# Altium schematic sheet Block_ADCS_Actuation.SchDoc
size A4; SheetNumber: 4; SheetTotal: 5
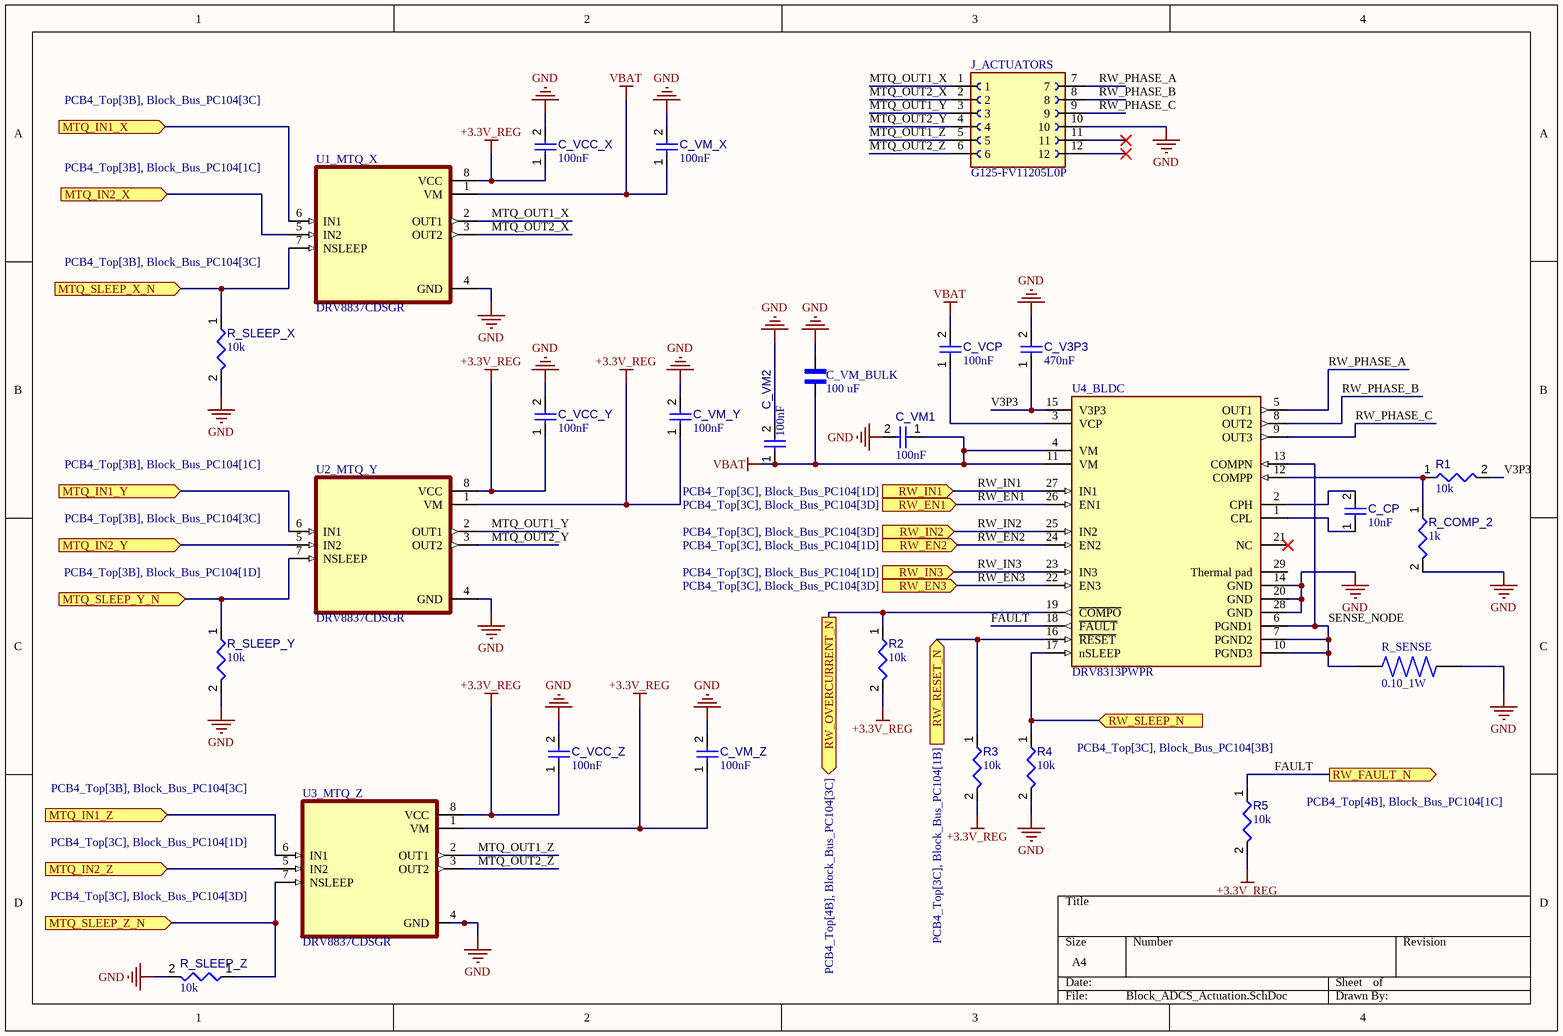
[diagram p0: Block_ADCS_Actuation.SchDoc]

## Parts
C_CP  value 10nF  [CAPC0402(1005)60_L]  (hidden comment: Capacitor 10nF +/-20% 50V 0402)
C_V3P3  value 470nF  [CAPC0603(1608)100_L]  (hidden comment: Capacitor 470nF +/-20% 25V 0603)
C_VCC_X  value 100nF  [CAPC1608X90X40NL10T20]  (hidden comment: Capacitor 100 nF +/-10% 50 V 0603)
C_VCC_Y  value 100nF  [CAPC1608X90X40NL10T20]  (hidden comment: Capacitor 100 nF +/-10% 50 V 0603)
C_VCC_Z  value 100nF  [CAPC1608X90X40NL10T20]  (hidden comment: Capacitor 100 nF +/-10% 50 V 0603)
C_VCP  value 100nF  [CAPC1608X90X40NL10T20]  (hidden comment: Capacitor 100 nF +/-10% 50 V 0603)
C_VM1  value 100nF  [CAPC1608X90X40NL10T20]  (hidden comment: Capacitor 100 nF +/-10% 50 V 0603)
C_VM2  value 100nF  [CAPC1608X90X40NL10T20]  (hidden comment: Capacitor 100 nF +/-10% 50 V 0603)
C_VM_BULK  100 uF  [CAPC3225X280N]
C_VM_X  value 100nF  [CAPC1608X90X40NL10T20]  (hidden comment: Capacitor 100 nF +/-10% 50 V 0603)
C_VM_Y  value 100nF  [CAPC1608X90X40NL10T20]  (hidden comment: Capacitor 100 nF +/-10% 50 V 0603)
C_VM_Z  value 100nF  [CAPC1608X90X40NL10T20]  (hidden comment: Capacitor 100 nF +/-10% 50 V 0603)
J_ACTUATORS  G125-FV11205L0P  [HARWIN_G125-FV11205L0P]
R1  value 10k  [RESC1608X55X25ML10T15]  (hidden comment: Resistor 10k +/-1% 0603 100 mW)
R2  value 10k  [RESC1608X55X25ML10T15]  (hidden comment: Resistor 10k +/-1% 0603 100 mW)
R3  value 10k  [RESC1608X55X25ML10T15]  (hidden comment: Resistor 10k +/-1% 0603 100 mW)
R4  value 10k  [RESC1608X55X25ML10T15]  (hidden comment: Resistor 10k +/-1% 0603 100 mW)
R5  value 10k  [RESC1608X55X25ML10T15]  (hidden comment: Resistor 10k +/-1% 0603 100 mW)
R_COMP_2  value 1k  [RESC1608X55X25ML10T15]  (hidden comment: Resistor 1k +/-1% 0603 100 mW)
R_SENSE  0.10_1W  [RESC3216X89N]
R_SLEEP_X  value 10k  [RESC1608X55X25ML10T15]  (hidden comment: Resistor 10k +/-1% 0603 100 mW)
R_SLEEP_Y  value 10k  [RESC1608X55X25ML10T15]  (hidden comment: Resistor 10k +/-1% 0603 100 mW)
R_SLEEP_Z  value 10k  [RESC1608X55X25ML10T15]  (hidden comment: Resistor 10k +/-1% 0603 100 mW)
U1_MTQ_X  DRV8837CDSGR  [SON50P200X200X80-9N]
U2_MTQ_Y  DRV8837CDSGR  [SON50P200X200X80-9N]
U3_MTQ_Z  DRV8837CDSGR  [SON50P200X200X80-9N]
U4_BLDC  DRV8313PWPR  [FP-PWP0028C-IPC_A]

## Ports
MTQ_IN1_X (in, see PCB4_Top[3B], Block_Bus_PC104[3C]), MTQ_IN1_Y (in, see PCB4_Top[3B], Block_Bus_PC104[1C]), MTQ_IN1_Z (in, see PCB4_Top[3B], Block_Bus_PC104[3C]), MTQ_IN2_X (in, see PCB4_Top[3B], Block_Bus_PC104[1C]), MTQ_IN2_Y (in, see PCB4_Top[3B], Block_Bus_PC104[3C]), MTQ_IN2_Z (in, see PCB4_Top[3C], Block_Bus_PC104[1D]), MTQ_SLEEP_X_N (in, see PCB4_Top[3B], Block_Bus_PC104[3C]), MTQ_SLEEP_Y_N (in, see PCB4_Top[3B], Block_Bus_PC104[1D]), MTQ_SLEEP_Z_N (in, see PCB4_Top[3C], Block_Bus_PC104[3D]), RW_EN1 (in, see PCB4_Top[3C], Block_Bus_PC104[3D]), RW_EN2 (in, see PCB4_Top[3C], Block_Bus_PC104[1D]), RW_EN3 (in, see PCB4_Top[3C], Block_Bus_PC104[3D]), RW_FAULT_N (out, see PCB4_Top[4B], Block_Bus_PC104[1C]), RW_IN1 (in, see PCB4_Top[3C], Block_Bus_PC104[1D]), RW_IN2 (in, see PCB4_Top[3C], Block_Bus_PC104[3D]), RW_IN3 (in, see PCB4_Top[3C], Block_Bus_PC104[1D]), RW_OVERCURRENT_N (out, see PCB4_Top[4B], Block_Bus_PC104[3C]), RW_RESET_N (in, see PCB4_Top[3C], Block_Bus_PC104[1B]), RW_SLEEP_N (in, see PCB4_Top[3C], Block_Bus_PC104[3B])

## Nets
+3.3V_REG: C_VCC_X.1 C_VCC_Y.1 C_VCC_Z.1 C_VM_Y.1 C_VM_Z.1 R2.2 R3.2 R5.2 U1_MTQ_X.8(VCC) U2_MTQ_Y.1(VM) U2_MTQ_Y.8(VCC) U3_MTQ_Z.1(VM) U3_MTQ_Z.8(VCC)
GND: C_V3P3.2 C_VCC_X.2 C_VCC_Y.2 C_VCC_Z.2 C_VM1.2 C_VM2.2 C_VM_BULK.2 C_VM_X.2 C_VM_Y.2 C_VM_Z.2 J_ACTUATORS.10 R4.2 R_COMP_2.2 R_SENSE.2 R_SLEEP_X.2 R_SLEEP_Y.2 R_SLEEP_Z.2 U1_MTQ_X.4(GND) U2_MTQ_Y.4(GND) U3_MTQ_Z.4(GND) U4_BLDC.14(GND) U4_BLDC.20(GND) U4_BLDC.28(GND)
VBAT: C_VCP.2 C_VM1.1 C_VM2.1 C_VM_BULK.1 C_VM_X.1 U1_MTQ_X.1(VM) U4_BLDC.4(VM) U4_BLDC.11(VM)
FAULT: R5.1 U4_BLDC.18(~{FAULT}) ; port RW_FAULT_N
MTQ_IN1_X: U1_MTQ_X.6(IN1) ; port MTQ_IN1_X
MTQ_IN1_Y: U2_MTQ_Y.6(IN1) ; port MTQ_IN1_Y
MTQ_IN1_Z: U3_MTQ_Z.6(IN1) ; port MTQ_IN1_Z
MTQ_IN2_X: U1_MTQ_X.5(IN2) ; port MTQ_IN2_X
MTQ_IN2_Y: U2_MTQ_Y.5(IN2) ; port MTQ_IN2_Y
MTQ_IN2_Z: U3_MTQ_Z.5(IN2) ; port MTQ_IN2_Z
MTQ_OUT1_X: J_ACTUATORS.1 U1_MTQ_X.2(OUT1)
MTQ_OUT1_Y: J_ACTUATORS.3 U2_MTQ_Y.2(OUT1)
MTQ_OUT1_Z: J_ACTUATORS.5 U3_MTQ_Z.2(OUT1)
MTQ_OUT2_X: J_ACTUATORS.2 U1_MTQ_X.3(OUT2)
MTQ_OUT2_Y: J_ACTUATORS.4 U2_MTQ_Y.3(OUT2)
MTQ_OUT2_Z: J_ACTUATORS.6 U3_MTQ_Z.3(OUT2)
MTQ_SLEEP_X_N: R_SLEEP_X.1 U1_MTQ_X.7(NSLEEP) ; port MTQ_SLEEP_X_N
MTQ_SLEEP_Y_N: R_SLEEP_Y.1 U2_MTQ_Y.7(NSLEEP) ; port MTQ_SLEEP_Y_N
MTQ_SLEEP_Z_N: R_SLEEP_Z.1 U3_MTQ_Z.7(NSLEEP) ; port MTQ_SLEEP_Z_N
RW_EN1: U4_BLDC.26(EN1) ; port RW_EN1
RW_EN2: U4_BLDC.24(EN2) ; port RW_EN2
RW_EN3: U4_BLDC.22(EN3) ; port RW_EN3
RW_IN1: U4_BLDC.27(IN1) ; port RW_IN1
RW_IN2: U4_BLDC.25(IN2) ; port RW_IN2
RW_IN3: U4_BLDC.23(IN3) ; port RW_IN3
RW_OVERCURRENT_N: R2.1 U4_BLDC.19(~{COMPO}) ; port RW_OVERCURRENT_N
RW_PHASE_A: J_ACTUATORS.7 U4_BLDC.5(OUT1)
RW_PHASE_B: J_ACTUATORS.8 U4_BLDC.8(OUT2)
RW_PHASE_C: J_ACTUATORS.9 U4_BLDC.9(OUT3)
RW_RESET_N: R3.1 U4_BLDC.16(~{RESET}) ; port RW_RESET_N
RW_SLEEP_N: R4.1 U4_BLDC.17(nSLEEP) ; port RW_SLEEP_N
SENSE_NODE: R_SENSE.1 U4_BLDC.6(PGND1) U4_BLDC.7(PGND2) U4_BLDC.10(PGND3) U4_BLDC.13(COMPN)
V3P3: C_V3P3.1 R1.2 U4_BLDC.15(V3P3)
NetC_CP_1: C_CP.1 U4_BLDC.1(CPL)
NetC_CP_2: C_CP.2 U4_BLDC.2(CPH)
NetC_VCP_1: C_VCP.1 U4_BLDC.3(VCP)
NetR1_1: R1.1 R_COMP_2.1 U4_BLDC.12(COMPP)

Not connected (* = marked no-connect by the designer): J_ACTUATORS 11* 12*; U4_BLDC 21(NC)* 29(Thermal_pad)

## Library data of the parts
C_CP = CMP-001-00069-3: Chip Capacitor, 10nF +/-20%, 50V, 0402, Thickness 0.6 mm; Tolerance: 5%; Max Operating Temperature: 85°C; Pins: 2; Case/Package: 0402; Voltage Rating: 50V; Min Operating Temperature: -55°C; Mounting Technology: SMT
C_V3P3 = CMP-001-00077-3: Chip Capacitor, 470nF +/-20%, 25V, 0603, Thickness 1 mm; Tolerance: 10%; Max Operating Temperature: 85°C; Voltage Rating: 25V; Pins: 2; Case/Package: 0603; Mounting Technology: SMT; Min Operating Temperature: -55°C
C_VCC_X C_VCC_Y C_VCC_Z C_VCP C_VM1 C_VM2 C_VM_X C_VM_Y C_VM_Z = CMP-001-00017-6: Chip Capacitor, 100 nF, +/- 10%, 50 V, 0603 (1608 Metric); Voltage Rating: 50V; Capacitor Type: Ceramic; Tolerance: 10%; Mounting Technology: SM; Max Operating Temperature: 125°C; RoHS Compliant: True; Pins: 2; Case/Package: 0603; Min Operating Temperature: -55°C
C_VM_BULK = CL32A107MPVNNNE: CL32 Series 100 uF 10 V Â±20 % Tolerance X5R SMT Multilayer Ceramic Capacitor; MF: Samsung Electro-Mechanics; SnapEDA_Link: https://www.snapeda.com/parts/CL32A107MPVNNNE/Samsung/view-part/?ref=snap; Package: SMD-2 Samsung; Value: *; MP: CL32A107MPVNNNE; Check_prices: https://www.snapeda.com/parts/CL32A107MPVNNNE/Samsung/view-part/?ref=eda
R1-R5 R_SLEEP_X R_SLEEP_Y R_SLEEP_Z = CMP-009-00017-5: Chip Resistor, 10 KOhm, +/- 1%, 01 W, -55 to 155 degC, 0603 (1608 Metric); Voltage Rating: 50V; Power: 100mW; RoHS Compliant: True; Min Operating Temperature: -55°C; Pins: 2; Case/Package: 0603; Mounting Technology: SM; Max Operating Temperature: 155°C; Tolerance: 1%
R_COMP_2 = CMP-009-00014-5: Chip Resistor, 1 KOhm, +/-1%, 0.1 W, -55 to 155 degC, 0603 (1608 Metric); Voltage Rating: 50V; Power: 100mW; Tolerance: 1%; Mounting Technology: SM; Pins: 2; Case/Package: 0603; Min Operating Temperature: -55°C; RoHS Compliant: True; Max Operating Temperature: 155°C
R_SENSE = PE1206FRF470R1L: 100 mOhms Â±1% 1W Chip Resistor 1206 (3216 Metric) Automotive AEC-Q200, Current Sense, Moisture Resistant Metal Foil; MF: Yageo; SnapEDA_Link: https://www.snapeda.com/parts/PE1206FRF470R1L/Yageo/view-part/?ref=snap; Package: 3216 Yageo; Value: *; MP: PE1206FRF470R1L; Check_prices: https://www.snapeda.com/parts/PE1206FRF470R1L/Yageo/view-part/?ref=eda
U1_MTQ_X U2_MTQ_Y U3_MTQ_Z = DRV8837CDSGR: 12-V, 1-A H-bridge motor driver; MF: Texas Instruments; SnapEDA_Link: https://www.snapeda.com/parts/DRV8837CDSGR/Texas+Instruments/view-part/?ref=snap; Package: WSON-8 Texas Instruments; Value: *; MP: DRV8837CDSGR; Check_prices: https://www.snapeda.com/parts/DRV8837CDSGR/Texas+Instruments/view-part/?ref=eda; Manufacturer: Texas Instruments; Manufacturer Part Number: DRV8837CDSGR; Reference: DRV8837C
U4_BLDC = CMP-04915-000025-1: IC MOTOR DRIVER 8V-60V 28HTSSOP; Min Supply Voltage: 8V; Max Supply Voltage: 60V; Interface: Parallel; Output Current: 1.75A; Number of Outputs: 1; Logic Function: AND GATE; Package Quantity: 2000; Number of Pins: 28; Case/Package: HTSSOP; Min Operating Temperature: -40°C; Mount: Surface Mount; Series: -; Packaging: Tape and Reel; Max Operating Temperature: 125°C; Lead Free: Lead Free
J_ACTUATORS = G125-FV11205L0P: Package: None; Price: None; Value: *; MP: G125-FV11205L0P; Availability: Unavailable